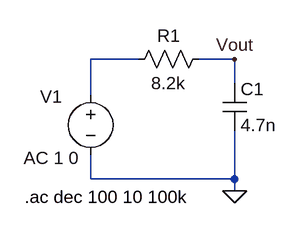
[diagram p0: schematic lowpass_filter.asc]
lowpass_filter.asc, the LTspice schematic file:
Version 4.1
SHEET 1 880 680
WIRE 48 192 -16 192
WIRE 176 192 128 192
WIRE 176 224 176 192
WIRE -16 240 -16 192
WIRE -16 352 -16 320
WIRE 176 352 176 288
WIRE 176 352 -16 352
WIRE 176 368 176 352
FLAG 176 368 0
FLAG 176 192 Vout
SYMBOL voltage -16 224 R0
WINDOW 0 -67 18 Left 2
WINDOW 123 -89 100 Left 2
WINDOW 39 0 0 Left 0
SYMATTR InstName V1
SYMATTR Value ""
SYMATTR Value2 AC 1 0
SYMBOL res 144 176 R90
WINDOW 0 0 56 VBottom 2
WINDOW 3 32 56 VTop 2
SYMATTR InstName R1
SYMATTR Value 8.2k
SYMBOL cap 160 224 R0
SYMATTR InstName C1
SYMATTR Value 4.7n
TEXT -104 376 Left 2 !.ac dec 100 10 100k

The netlist it stands for:
* lowpass_filter.asc
V1 N001 0 AC 1 0
R1 Vout N001 8.2k
C1 Vout 0 4.7n
.ac dec 100 10 100k
.backanno
.end